# Altium schematic sheet DCDC-BOARD.SchDoc
size A4; SheetNumber: 3; SheetTotal: 4
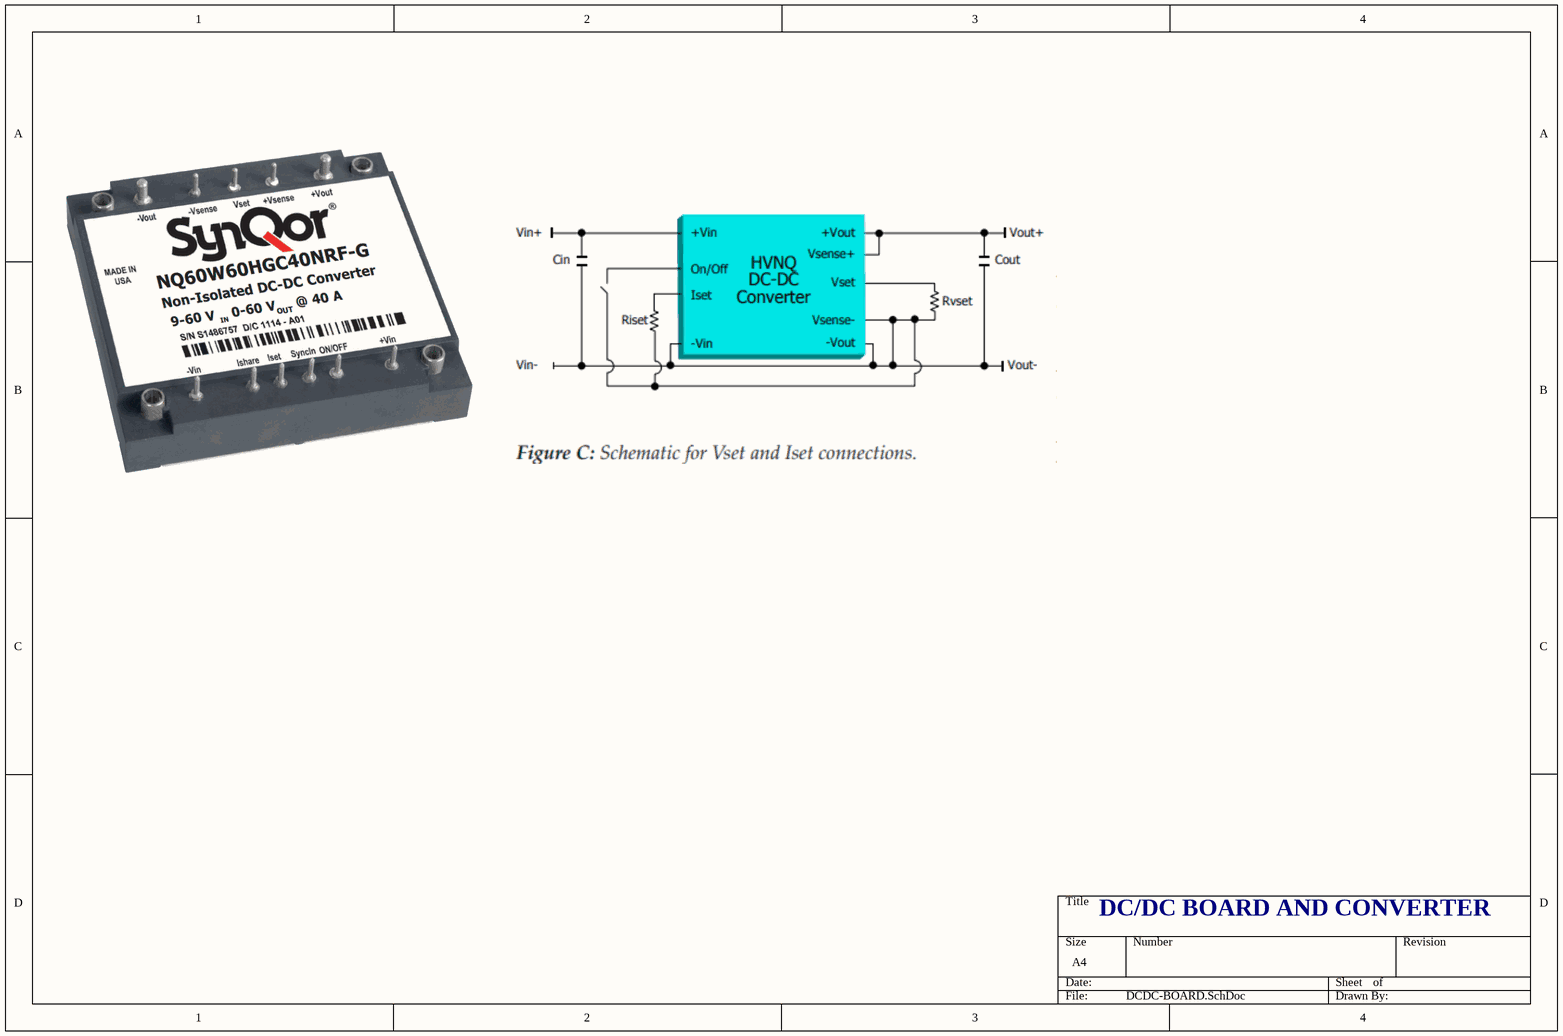
[diagram p0: DCDC-BOARD.SchDoc]

## Notes on the sheet
- DC/DC BOARD AND CONVERTER